# Altium schematic sheet hot_handle_part.SchDoc
size A3; SheetNumber: 2; SheetTotal: 2
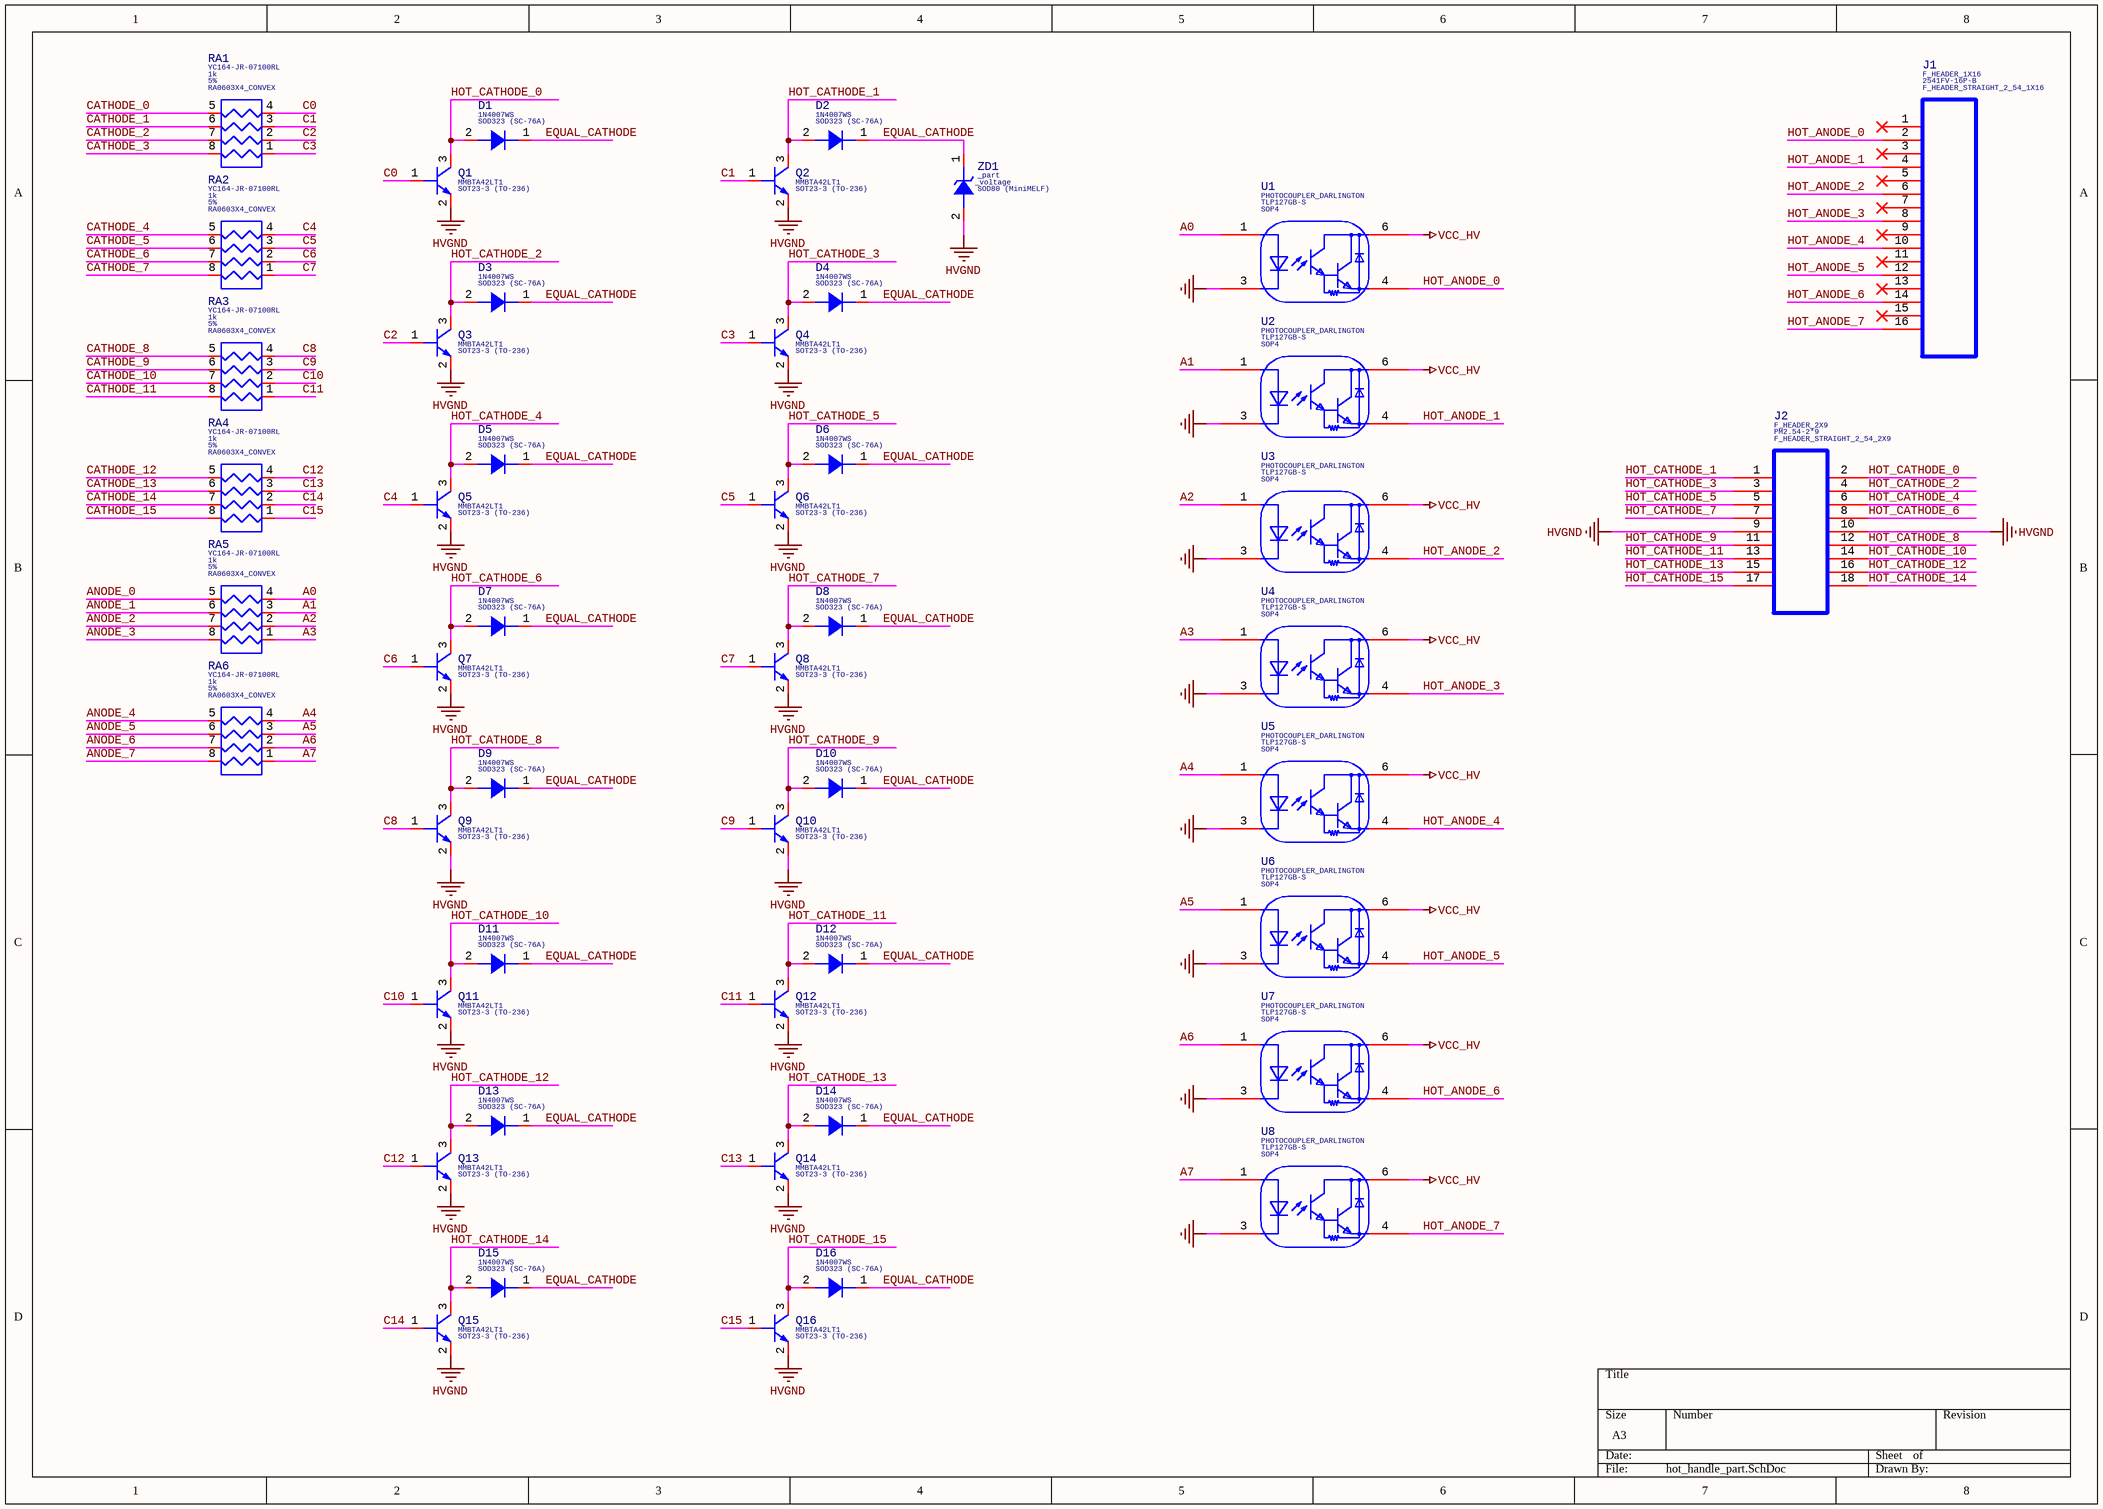
[diagram p0: hot_handle_part.SchDoc]

## Parts
D1  Part Reference: 1N4007WS  [SOD323 (SC-76A)]  (hidden comment: DIODE)
D2  Part Reference: 1N4007WS  [SOD323 (SC-76A)]  (hidden comment: DIODE)
D3  Part Reference: 1N4007WS  [SOD323 (SC-76A)]  (hidden comment: DIODE)
D4  Part Reference: 1N4007WS  [SOD323 (SC-76A)]  (hidden comment: DIODE)
D5  Part Reference: 1N4007WS  [SOD323 (SC-76A)]  (hidden comment: DIODE)
D6  Part Reference: 1N4007WS  [SOD323 (SC-76A)]  (hidden comment: DIODE)
D7  Part Reference: 1N4007WS  [SOD323 (SC-76A)]  (hidden comment: DIODE)
D8  Part Reference: 1N4007WS  [SOD323 (SC-76A)]  (hidden comment: DIODE)
D9  Part Reference: 1N4007WS  [SOD323 (SC-76A)]  (hidden comment: DIODE)
D10  Part Reference: 1N4007WS  [SOD323 (SC-76A)]  (hidden comment: DIODE)
D11  Part Reference: 1N4007WS  [SOD323 (SC-76A)]  (hidden comment: DIODE)
D12  Part Reference: 1N4007WS  [SOD323 (SC-76A)]  (hidden comment: DIODE)
D13  Part Reference: 1N4007WS  [SOD323 (SC-76A)]  (hidden comment: DIODE)
D14  Part Reference: 1N4007WS  [SOD323 (SC-76A)]  (hidden comment: DIODE)
D15  Part Reference: 1N4007WS  [SOD323 (SC-76A)]  (hidden comment: DIODE)
D16  Part Reference: 1N4007WS  [SOD323 (SC-76A)]  (hidden comment: DIODE)
J1  F_HEADER_1X16  Part Reference: 2541FV-16P-B  [F_HEADER_STRAIGHT_2_54_1X16]
J2  F_HEADER_2X9  Part Reference: PM2.54-2*9  [F_HEADER_STRAIGHT_2_54_2X9]
Q1  Part Reference: MMBTA42LT1  [SOT23-3 (TO-236)]  (hidden comment: NPN)
Q2  Part Reference: MMBTA42LT1  [SOT23-3 (TO-236)]  (hidden comment: NPN)
Q3  Part Reference: MMBTA42LT1  [SOT23-3 (TO-236)]  (hidden comment: NPN)
Q4  Part Reference: MMBTA42LT1  [SOT23-3 (TO-236)]  (hidden comment: NPN)
Q5  Part Reference: MMBTA42LT1  [SOT23-3 (TO-236)]  (hidden comment: NPN)
Q6  Part Reference: MMBTA42LT1  [SOT23-3 (TO-236)]  (hidden comment: NPN)
Q7  Part Reference: MMBTA42LT1  [SOT23-3 (TO-236)]  (hidden comment: NPN)
Q8  Part Reference: MMBTA42LT1  [SOT23-3 (TO-236)]  (hidden comment: NPN)
Q9  Part Reference: MMBTA42LT1  [SOT23-3 (TO-236)]  (hidden comment: NPN)
Q10  Part Reference: MMBTA42LT1  [SOT23-3 (TO-236)]  (hidden comment: NPN)
Q11  Part Reference: MMBTA42LT1  [SOT23-3 (TO-236)]  (hidden comment: NPN)
Q12  Part Reference: MMBTA42LT1  [SOT23-3 (TO-236)]  (hidden comment: NPN)
Q13  Part Reference: MMBTA42LT1  [SOT23-3 (TO-236)]  (hidden comment: NPN)
Q14  Part Reference: MMBTA42LT1  [SOT23-3 (TO-236)]  (hidden comment: NPN)
Q15  Part Reference: MMBTA42LT1  [SOT23-3 (TO-236)]  (hidden comment: NPN)
Q16  Part Reference: MMBTA42LT1  [SOT23-3 (TO-236)]  (hidden comment: NPN)
RA1  value 1k  Tolerancy: 5%  Part Reference: YC164-JR-07100RL  [RA0603X4_CONVEX]  (hidden comment: RESISTOR_ARRAY_X4)
RA2  value 1k  Tolerancy: 5%  Part Reference: YC164-JR-07100RL  [RA0603X4_CONVEX]  (hidden comment: RESISTOR_ARRAY_X4)
RA3  value 1k  Tolerancy: 5%  Part Reference: YC164-JR-07100RL  [RA0603X4_CONVEX]  (hidden comment: RESISTOR_ARRAY_X4)
RA4  value 1k  Tolerancy: 5%  Part Reference: YC164-JR-07100RL  [RA0603X4_CONVEX]  (hidden comment: RESISTOR_ARRAY_X4)
RA5  value 1k  Tolerancy: 5%  Part Reference: YC164-JR-07100RL  [RA0603X4_CONVEX]  (hidden comment: RESISTOR_ARRAY_X4)
RA6  value 1k  Tolerancy: 5%  Part Reference: YC164-JR-07100RL  [RA0603X4_CONVEX]  (hidden comment: RESISTOR_ARRAY_X4)
U1  PHOTOCOUPLER_DARLINGTON  Part Reference: TLP127GB-S  [SOP4]
U2  PHOTOCOUPLER_DARLINGTON  Part Reference: TLP127GB-S  [SOP4]
U3  PHOTOCOUPLER_DARLINGTON  Part Reference: TLP127GB-S  [SOP4]
U4  PHOTOCOUPLER_DARLINGTON  Part Reference: TLP127GB-S  [SOP4]
U5  PHOTOCOUPLER_DARLINGTON  Part Reference: TLP127GB-S  [SOP4]
U6  PHOTOCOUPLER_DARLINGTON  Part Reference: TLP127GB-S  [SOP4]
U7  PHOTOCOUPLER_DARLINGTON  Part Reference: TLP127GB-S  [SOP4]
U8  PHOTOCOUPLER_DARLINGTON  Part Reference: TLP127GB-S  [SOP4]
ZD1  Voltage: _voltage  Part Reference: _part  [SOD80 (MiniMELF)]  (hidden comment: DIODE_ZENER)

## Nets
GND: U1.3 U2.3 U3.3 U4.3 U5.3 U6.3 U7.3 U8.3
HVGND: J2.9 J2.10 Q1.2(EMITTER) Q2.2(EMITTER) Q3.2(EMITTER) Q4.2(EMITTER) Q5.2(EMITTER) Q6.2(EMITTER) Q7.2(EMITTER) Q8.2(EMITTER) Q9.2(EMITTER) Q10.2(EMITTER) Q11.2(EMITTER) Q12.2(EMITTER) Q13.2(EMITTER) Q14.2(EMITTER) Q15.2(EMITTER) Q16.2(EMITTER) ZD1.2(A)
VCC_HV: U1.6 U2.6 U3.6 U4.6 U5.6 U6.6 U7.6 U8.6
A0: RA5.4 U1.1
A1: RA5.3 U2.1
A2: RA5.2 U3.1
A3: RA5.1 U4.1
A4: RA6.4 U5.1
A5: RA6.3 U6.1
A6: RA6.2 U7.1
A7: RA6.1 U8.1
ANODE_0: RA5.5
ANODE_1: RA5.6
ANODE_2: RA5.7
ANODE_3: RA5.8
ANODE_4: RA6.5
ANODE_5: RA6.6
ANODE_6: RA6.7
ANODE_7: RA6.8
C0: Q1.1(BASE) RA1.4
C1: Q2.1(BASE) RA1.3
C2: Q3.1(BASE) RA1.2
C3: Q4.1(BASE) RA1.1
C4: Q5.1(BASE) RA2.4
C5: Q6.1(BASE) RA2.3
C6: Q7.1(BASE) RA2.2
C7: Q8.1(BASE) RA2.1
C8: Q9.1(BASE) RA3.4
C9: Q10.1(BASE) RA3.3
C10: Q11.1(BASE) RA3.2
C11: Q12.1(BASE) RA3.1
C12: Q13.1(BASE) RA4.4
C13: Q14.1(BASE) RA4.3
C14: Q15.1(BASE) RA4.2
C15: Q16.1(BASE) RA4.1
CATHODE_0: RA1.5
CATHODE_1: RA1.6
CATHODE_2: RA1.7
CATHODE_3: RA1.8
CATHODE_4: RA2.5
CATHODE_5: RA2.6
CATHODE_6: RA2.7
CATHODE_7: RA2.8
CATHODE_8: RA3.5
CATHODE_9: RA3.6
CATHODE_10: RA3.7
CATHODE_11: RA3.8
CATHODE_12: RA4.5
CATHODE_13: RA4.6
CATHODE_14: RA4.7
CATHODE_15: RA4.8
EQUAL_CATHODE: D1.1(C) D2.1(C) D3.1(C) D4.1(C) D5.1(C) D6.1(C) D7.1(C) D8.1(C) D9.1(C) D10.1(C) D11.1(C) D12.1(C) D13.1(C) D14.1(C) D15.1(C) D16.1(C) ZD1.1(C)
HOT_ANODE_0: J1.2 U1.4
HOT_ANODE_1: J1.4 U2.4
HOT_ANODE_2: J1.6 U3.4
HOT_ANODE_3: J1.8 U4.4
HOT_ANODE_4: J1.10 U5.4
HOT_ANODE_5: J1.12 U6.4
HOT_ANODE_6: J1.14 U7.4
HOT_ANODE_7: J1.16 U8.4
HOT_CATHODE_0: D1.2(A) J2.2 Q1.3(COLLECTOR)
HOT_CATHODE_1: D2.2(A) J2.1 Q2.3(COLLECTOR)
HOT_CATHODE_2: D3.2(A) J2.4 Q3.3(COLLECTOR)
HOT_CATHODE_3: D4.2(A) J2.3 Q4.3(COLLECTOR)
HOT_CATHODE_4: D5.2(A) J2.6 Q5.3(COLLECTOR)
HOT_CATHODE_5: D6.2(A) J2.5 Q6.3(COLLECTOR)
HOT_CATHODE_6: D7.2(A) J2.8 Q7.3(COLLECTOR)
HOT_CATHODE_7: D8.2(A) J2.7 Q8.3(COLLECTOR)
HOT_CATHODE_8: D9.2(A) J2.12 Q9.3(COLLECTOR)
HOT_CATHODE_9: D10.2(A) J2.11 Q10.3(COLLECTOR)
HOT_CATHODE_10: D11.2(A) J2.14 Q11.3(COLLECTOR)
HOT_CATHODE_11: D12.2(A) J2.13 Q12.3(COLLECTOR)
HOT_CATHODE_12: D13.2(A) J2.16 Q13.3(COLLECTOR)
HOT_CATHODE_13: D14.2(A) J2.15 Q14.3(COLLECTOR)
HOT_CATHODE_14: D15.2(A) J2.18 Q15.3(COLLECTOR)
HOT_CATHODE_15: D16.2(A) J2.17 Q16.3(COLLECTOR)

Not connected (* = marked no-connect by the designer): J1 1* 3* 5* 7* 9* 11* 13* 15*

## Library data of the parts
D1-D16 = DIODE: Manufacturer: HXY MOSFET; PCB Footprint: SOD323 (SC-76A)
J1 = F_HEADER_1X16: Manufacturer: HanElectricity; PCB Footprint: F_HEADER_STRAIGHT_2_54_1X16
J2 = F_HEADER_2X9: Manufacturer: ZHOURI; PCB Footprint: F_HEADER_STRAIGHT_2_54_2X9
Q1-Q16 = NPN: Manufacturer: _manufacturer; PCB Footprint: SOT23-3 (TO-236)
RA1-RA6 = RESISTOR_ARRAY_X4: Manufacturer: YAGEO; PCB Footprint: RA0603X4_CONVEX
U1-U8 = PHOTOCOUPLER_DARLINGTON: Manufacturer: UMW; PCB Footprint: SOP4
ZD1 = DIODE_ZENER: Manufacturer: _manufacturer; PCB Footprint: SOD80 (MiniMELF)